# Altium schematic sheet push-button-switch-10.SchDoc
size A4; SheetNumber: 10; SheetTotal: 17
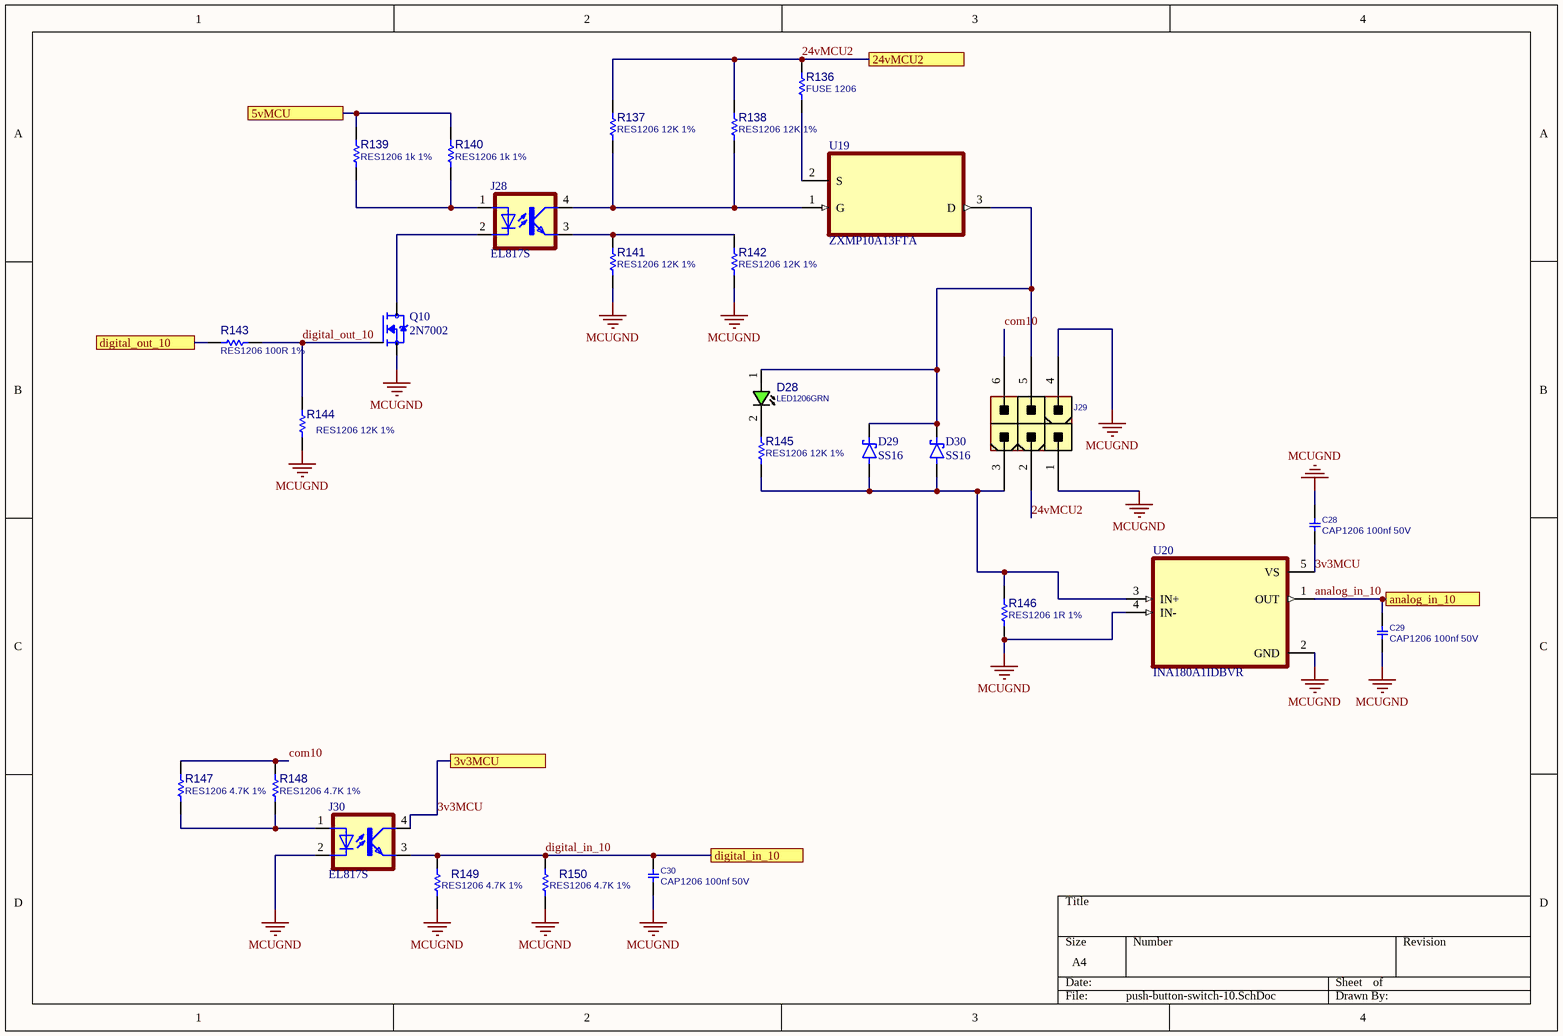
[diagram p0: push-button-switch-10.SchDoc]

## Parts
C28  CAP1206 100nf 50V  [C1206]
C29  CAP1206 100nf 50V  [C1206]
C30  CAP1206 100nf 50V  [C1206]
D28  LED1206GRN  [LED1206GRN]
D29  SS16  [DIOM4325X250N]
D30  SS16  [DIOM4325X250N]
J28  EL817S  [SOIC254P1030X460-4N]
J29  CONN_ATXPWR_6  [ATXPWR_6]  (value not drawn)
J30  EL817S  [SOIC254P1030X460-4N]
Q10  2N7002  [SOT95P240X111-3N]
R136  FUSE 1206  [R1206]
R137  RES1206 12K 1%  [R1206]
R138  RES1206 12K 1%  [R1206]
R139  RES1206 1k 1%  [R1206]
R140  RES1206 1k 1%  [R1206]
R141  RES1206 12K 1%  [R1206]
R142  RES1206 12K 1%  [R1206]
R143  RES1206 100R 1%  [R1206]
R144  RES1206 12K 1%  [R1206]
R145  RES1206 12K 1%  [R1206]
R146  RES1206 1R 1%  [R1206]
R147  RES1206 4.7K 1%  [R1206]
R148  RES1206 4.7K 1%  [R1206]
R149  RES1206 4.7K 1%  [R1206]
R150  RES1206 4.7K 1%  [R1206]
U19  ZXMP10A13FTA  [SOT95P230X110-3N]
U20  INA180A1IDBVR  [SOT95P280X145-5N]

## Ports
3v3MCU, 5vMCU, 24vMCU2, analog_in_10, digital_in_10, digital_out_10

## Nets
MCUGND: C28.1 C29.2 C30.2 J29.1 J29.4 J30.2(C) Q10.2(S) R141.2 R142.2 R144.2 R146.2 R149.1 R150.1 U20.2(GND) U20.4(IN-)
3v3MCU: C28.2 J30.4(COL) U20.5(VS) ; port 3v3MCU
5vMCU: R139.2 R140.2 ; port 5vMCU
24vMCU2: J29.2 R136.1 R137.1 R138.1 ; port 24vMCU2
analog_in_10: C29.1 U20.1(OUT) ; port analog_in_10
com10: J29.6 R147.2 R148.2
digital_in_10: C30.1 J30.3(EMIT) R149.2 R150.2 ; port digital_in_10
digital_out_10: Q10.1(G) R143.2 R144.1
digital_out_10: R143.1 ; port digital_out_10  [a separate net that carries the same name]
NetD28_1: D28.1(ANODE) D29.C(K) D30.C(K) J29.5 U19.3(D)
NetD28_2: D28.2(CATHODE) R145.1
NetD29_A: D29.A D30.A J29.3 R145.2 R146.1 U20.3(IN+)
NetJ28_1: J28.1(A) R139.1 R140.1
NetJ28_2: J28.2(C) Q10.3(D)
NetJ28_3: J28.3(EMIT) R141.1 R142.1
NetJ28_4: J28.4(COL) R137.2 R138.2 U19.1(G)
NetJ30_1: J30.1(A) R147.1 R148.1
NetR136_2: R136.2 U19.2(S)

## Library data of the parts
C28-C30 = CAP_SMD_MLCC_1206: CAP, MLCC; PARAM: -, -%; MANF_P#: MANF_PART#; PARAM2: -V; PRICE: 100= 1$; MANF: -; ASSEMBLY: ASSEMBLY
D28 = LED_SMD_1206_GRN: LED, SMD, 1206, GREEN; PARAM: 20mA; DESC: DESCRIPTION; PARAM2: 2.2V; MANF: -; ASSEMBLY: ASSEMBLY; PRICE: 36t@Javan; MANF_P#: -; VALUE: LED1206GRN; MountType: SMT; PartType: LED
D29 D30 = SS14: 1A, 40V, Schottky Rectifier; MF: Taiwan Semiconductor; SnapEDA_Link: https://www.snapeda.com/parts/SS14/taiwan/view-part/?ref=snap; Package: SMA-2 Taiwan Semiconductor; Value: *; MP: SS14; Check_prices: https://www.snapeda.com/parts/SS14/taiwan/view-part/?ref=eda
J28 J30 = EL817S: Optoisolator Transistor Output 5000Vrms 1 Channel 4-SMD; MF: Everlight Electronics; SnapEDA_Link: https://www.snapeda.com/parts/EL817S/Everlight+Electronics+Co+Ltd/view-part/?ref=snap; Package: SMD-4 Everlight Electronics Co Ltd; Value: *; MP: EL817S; Check_prices: https://www.snapeda.com/parts/EL817S/Everlight+Electronics+Co+Ltd/view-part/?ref=eda
J29 = CONN_ATXPWR_6: CONN, ATX POWER, 6 P; MANF: TE; MANF_P#: 4-1775099-1; VALUE: CONN_ATXPWR_6; MountType: THD; PACKAGE: ATXPWR-6pin; Part Type: Conn.
Q10 = 2N7002: N-Channel 60V 280mA (Ta) 350mW (Ta) Surface Mount SOT-23-3 (TO-236); MF: {'manufacturer': u'onsemi'}; Package: None; Price: None; Value: *; MP: 2N7002; Availability: Unavailable
R136-R150 = RES_SMD_1206: RESISTOR, SMD; PARAM: 1%, 0.25W; DESC: DESCRIPTION; DIST#: MOUSER; MANF_P#: -; MANF: -; ASSEMBLY: ASSEMBLY; PRICE: -; PARAM2: -
U19 = ZXMP10A13FTA: P-Channel 100 V 600mA (Ta) 625mW (Ta) Surface Mount SOT-23-3; MF: Diodes Inc.; Purchase-URL: https://pricing.snapeda.com/search/part/ZXMP10A13FTA/?ref=eda; Package: SOT-23-3 Diodes Inc.; SnapEDA_Link: https://www.snapeda.com/parts/ZXMP10A13FTA/Diodes+Inc./view-part/?ref=snap; Availability: In Stock; Value: *; MP: ZXMP10A13FTA; Check_prices: https://www.snapeda.com/parts/ZXMP10A13FTA/Diodes+Inc./view-part/?ref=eda; Price: None
U20 = INA180A1IDBVR: 26V, 350kHz current sense amplifier; MF: Texas Instruments; SnapEDA_Link: https://www.snapeda.com/parts/INA180A1IDBVR/Texas+Instruments/view-part/?ref=snap; Package: SOT-23-5 Texas Instruments; Value: *; MP: INA180A1IDBVR; Check_prices: https://www.snapeda.com/parts/INA180A1IDBVR/Texas+Instruments/view-part/?ref=eda